# Altium project CW341_KintexUltraScaleTarget.PrjPcb (part 3 of 3)
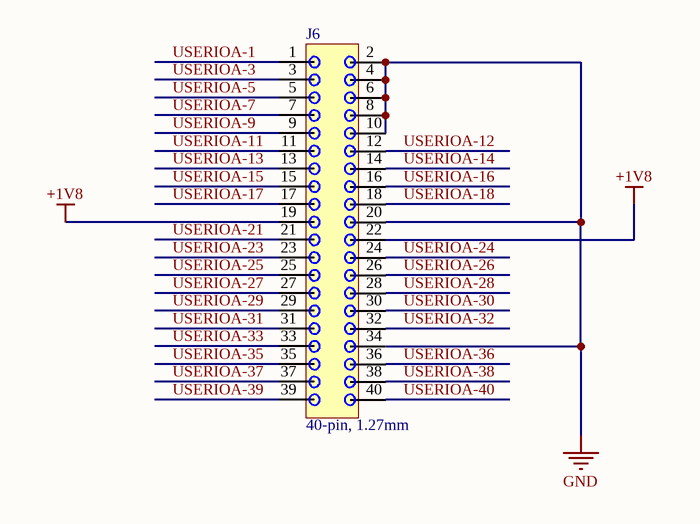
[diagram p17: CW341_FPGA_USERIOA.SchDoc]

## Nets that join several sheets
+1V0_VCCINT: CW341_FPGA_DECOUP (10 pins), CW341_FPGA_PWR (53 pins), CW341_PowerMeasure (TP1.1)
+1V0_VCCINT_SHUNTLOW: CW341_FPGA_PWR (PWR1.23 PWR1.24 PWR1.25), CW341_PowerMeasure (6 pins)
+1V8: CW341_Edge (J1.A7 J1.A8), CW341_FPGA_DECOUP (49 pins), CW341_FPGA_PWR (17 pins), CW341_FPGA_CFG (J2.2 R4.1), CW341_FPGAIO_1 (7 pins), CW341_FPGAIO_2 (13 pins), CW341_FPGAIO_3 (13 pins), CW341_FPGAIO_4 (7 pins), CW341_FPGAIO_5 (14 pins), CW341_SRAM (9 pins), CW341_HyperRam (12 pins), CW341_FPGA_USERIOA (J6.19 J6.22)
+1V85_XADC_VCC: CW341_FPGA_PWR (C28.1 U1.U12), CW341_XADC (7 pins)
+3V3: CW341_Edge (J1.A3 J1.A4), CW341_PowerMeasure (C88.1 L7.1), CW341_XADC (C19.1 L6.1)
+5V: CW341_Edge (J1.B3 J1.B4 J1.B5 J1.B6), CW341_FPGA_PWR (PWR1.1 PWR1.2 PWR1.3)
+VCCIOB: CW341_Edge (J1.B11), CW341_FPGA_DECOUP (6 pins), CW341_FPGAIO_1 (6 pins)
GND: CW341_Edge (30 pins), CW341_FPGA_DECOUP (65 pins), CW341_FPGA_PWR (284 pins), CW341_FPGA_CFG (11 pins), CW341_FPGA_MGT (U1.A33 U1.A34 U1.AP5 U1.AP6), CW341_FPGAIO_3 (R1.2), CW341_PowerMeasure (10 pins), CW341_SRAM (C9.2 C11.2 U2.12 U2.34), CW341_XADC (C19.2 L4.1), CW341_HyperRam (12 pins), CW341_FPGA_USERIOA (7 pins)
XADC_VREF_N: CW341_Edge (J1.A16 J1.B16), CW341_FPGA_PWR (C28.2 U1.V11), CW341_FPGAIO_2 (U1.AE15 U1.AF14 U1.AF18 U1.AL15), CW341_XADC (20 pins)
/USB_CE: CW341_Edge (J1.A81), CW341_FPGAIO_3 (U1.D23)
/USB_RD: CW341_Edge (J1.A80), CW341_FPGAIO_3 (U1.C23)
AD0P: CW341_FPGAIO_2 (U1.AE16), CW341_XADC (R16.2)
AD1P: CW341_FPGAIO_2 (U1.AF15), CW341_XADC (R17.2)
AD8P: CW341_FPGAIO_2 (U1.AE18), CW341_XADC (R7.2)
AD12P: CW341_FPGAIO_2 (U1.AK15), CW341_XADC (R6.2)
CFG_CLK: CW341_Edge (J1.A57), CW341_FPGA_CFG (R3.2)
CFG_D0: CW341_Edge (J1.A59), CW341_FPGA_CFG (U1.AC7)
CFG_D1: CW341_Edge (J1.B61), CW341_FPGA_CFG (U1.AB7)
CFG_D2: CW341_Edge (J1.A60), CW341_FPGA_CFG (U1.AA7)
CFG_D3: CW341_Edge (J1.B62), CW341_FPGA_CFG (U1.Y7)
CFG_D4: CW341_Edge (J1.A61), CW341_FPGAIO_3 (U1.M20)
CFG_D5: CW341_Edge (J1.B63), CW341_FPGAIO_3 (U1.L20)
CFG_D6: CW341_Edge (J1.A62), CW341_FPGAIO_3 (U1.R21)
CFG_D7: CW341_Edge (J1.B64), CW341_FPGAIO_3 (U1.R22)
CFG_D8_A0: CW341_Edge (J1.A63), CW341_FPGAIO_3 (U1.P20)
CFG_D9_A1: CW341_Edge (J1.B65), CW341_FPGAIO_3 (U1.P21)
CFG_D10_A2: CW341_Edge (J1.A64), CW341_FPGAIO_3 (U1.N22)
CFG_D11_A3: CW341_Edge (J1.B66), CW341_FPGAIO_3 (U1.M22)
CFG_D12_A4: CW341_Edge (J1.A65), CW341_FPGAIO_3 (U1.R23)
CFG_D13_A5: CW341_Edge (J1.B67), CW341_FPGAIO_3 (U1.P23)
CFG_D14_A6: CW341_Edge (J1.A66), CW341_FPGAIO_3 (U1.R25)
CFG_D15_A7: CW341_Edge (J1.B68), CW341_FPGAIO_3 (U1.R26)
CFG_DONE: CW341_Edge (J1.A68), CW341_FPGA_CFG (U1.N7)
CFG_DOUT: CW341_Edge (J1.B70), CW341_FPGAIO_3 (U1.K21)
CFG_EMCCLK: CW341_Edge (J1.B71), CW341_FPGAIO_3 (U1.K20)
CFG_INITB: CW341_Edge (J1.A70), CW341_FPGA_CFG (U1.V7)
CFG_PGM: CW341_Edge (J1.A69), CW341_FPGA_CFG (U1.T7)
CFG_RDWR: CW341_Edge (J1.A78), CW341_FPGA_CFG (U1.U7)
CWIO_HS1: CW341_Edge (J1.A27), CW341_FPGAIO_1 (U1.AK12)
CWIO_HS2: CW341_Edge (J1.B27), CW341_FPGAIO_1 (U1.AL12)
CWIO_IO4: CW341_Edge (J1.B26), CW341_FPGAIO_1 (U1.AM11)
FPGA_M0: CW341_Edge (J1.B79), CW341_FPGA_CFG (U1.K7)
FPGA_M1: CW341_Edge (J1.B80), CW341_FPGA_CFG (U1.L7)
FPGA_M2: CW341_Edge (J1.B81), CW341_FPGA_CFG (U1.M7)
HYPR_1_~{CS}: CW341_FPGAIO_4 (U1.F15), CW341_HyperRam (U3.A3)
HYPR_1_DQ0: CW341_FPGAIO_4 (U1.F17), CW341_HyperRam (U3.D3)
HYPR_1_DQ1: CW341_FPGAIO_4 (U1.D18), CW341_HyperRam (U3.D2)
HYPR_1_DQ2: CW341_FPGAIO_4 (U1.D16), CW341_HyperRam (U3.C4)
HYPR_1_DQ3: CW341_FPGAIO_4 (U1.E17), CW341_HyperRam (U3.D4)
HYPR_1_DQ4: CW341_FPGAIO_4 (U1.G19), CW341_HyperRam (U3.D5)
HYPR_1_DQ5: CW341_FPGAIO_4 (U1.H17), CW341_HyperRam (U3.E3)
HYPR_1_DQ6: CW341_FPGAIO_4 (U1.D19), CW341_HyperRam (U3.E2)
HYPR_1_DQ7: CW341_FPGAIO_4 (U1.E18), CW341_HyperRam (U3.E1)
HYPR_1_N: CW341_FPGAIO_4 (U1.G14), CW341_HyperRam (U3.B1)
HYPR_1_P: CW341_FPGAIO_4 (U1.G15), CW341_HyperRam (U3.B2)
HYPR_1_~{RESET}: CW341_FPGAIO_4 (U1.G16), CW341_HyperRam (U3.A4)
HYPR_1_RWDS: CW341_FPGAIO_4 (U1.E16), CW341_HyperRam (U3.C3)
HYPR_2_~{CS}: CW341_FPGAIO_4 (U1.L18), CW341_HyperRam (U4.A3)
HYPR_2_DQ0: CW341_FPGAIO_4 (U1.K18), CW341_HyperRam (U4.D3)
HYPR_2_DQ1: CW341_FPGAIO_4 (U1.J14), CW341_HyperRam (U4.D2)
HYPR_2_DQ2: CW341_FPGAIO_4 (U1.L15), CW341_HyperRam (U4.C4)
HYPR_2_DQ3: CW341_FPGAIO_4 (U1.J19), CW341_HyperRam (U4.D4)
HYPR_2_DQ4: CW341_FPGAIO_4 (U1.H19), CW341_HyperRam (U4.D5)
HYPR_2_DQ5: CW341_FPGAIO_4 (U1.K17), CW341_HyperRam (U4.E3)
HYPR_2_DQ6: CW341_FPGAIO_4 (U1.J15), CW341_HyperRam (U4.E2)
HYPR_2_DQ7: CW341_FPGAIO_4 (U1.J18), CW341_HyperRam (U4.E1)
HYPR_2_N: CW341_FPGAIO_4 (U1.J16), CW341_HyperRam (U4.B1)
HYPR_2_P: CW341_FPGAIO_4 (U1.K16), CW341_HyperRam (U4.B2)
HYPR_2_~{RESET}: CW341_FPGAIO_4 (U1.L19), CW341_HyperRam (U4.A4)
HYPR_2_RWDS: CW341_FPGAIO_4 (U1.K15), CW341_HyperRam (U4.C3)
OT_ADC1: CW341_Edge (J1.B12), CW341_XADC (R22.1)
OT_ADC2: CW341_Edge (J1.B13), CW341_XADC (R19.1)
OT_ANALOG0_ADC3: CW341_Edge (J1.B14), CW341_XADC (R13.1)
OT_ANALOG1_ADC4: CW341_Edge (J1.B15), CW341_XADC (R10.1)
OT_IOA0: CW341_Edge (J1.A29), CW341_FPGAIO_1 (U1.AN26)
OT_IOA1: CW341_Edge (J1.B29), CW341_FPGAIO_1 (U1.AK26)
OT_IOA2: CW341_Edge (J1.A30), CW341_FPGAIO_1 (U1.AN27)
OT_IOA3: CW341_Edge (J1.B30), CW341_FPGAIO_1 (U1.AP26)
OT_IOA4: CW341_Edge (J1.A31), CW341_FPGAIO_1 (U1.AP28)
OT_IOA5: CW341_Edge (J1.B31), CW341_FPGAIO_1 (U1.AM27)
OT_IOA6: CW341_Edge (J1.A32), CW341_FPGAIO_1 (U1.AP29)
OT_IOA7: CW341_Edge (J1.B32), CW341_FPGAIO_1 (U1.AN28)
OT_IOA8: CW341_Edge (J1.A33), CW341_FPGAIO_1 (U1.AP30)
OT_IOB0: CW341_Edge (J1.A18), CW341_FPGAIO_1 (U1.AP8)
OT_IOB1: CW341_Edge (J1.B18), CW341_FPGAIO_1 (U1.AN8)
OT_IOB2: CW341_Edge (J1.A19), CW341_FPGAIO_1 (U1.AP9)
OT_IOB3: CW341_Edge (J1.B19), CW341_FPGAIO_1 (U1.AL8)
OT_IOB4: CW341_Edge (J1.A20), CW341_FPGAIO_1 (U1.AL10)
OT_IOB5: CW341_Edge (J1.B20), CW341_FPGAIO_1 (U1.AN9)
OT_IOB6: CW341_Edge (J1.A21), CW341_FPGAIO_1 (U1.AM10)
OT_IOB7: CW341_Edge (J1.B21), CW341_FPGAIO_1 (U1.AP10)
OT_IOB8: CW341_Edge (J1.A22), CW341_FPGAIO_1 (U1.AL9)
OT_IOB9: CW341_Edge (J1.B22), CW341_FPGAIO_1 (U1.AP11)
OT_IOB10: CW341_Edge (J1.A23), CW341_FPGAIO_1 (U1.AM12)
OT_IOB11: CW341_Edge (J1.B23), CW341_FPGAIO_1 (U1.AN11)
OT_IOB12: CW341_Edge (J1.A24), CW341_FPGAIO_1 (U1.AN12)
OT_IOC0: CW341_Edge (J1.A50), CW341_FPGAIO_3 (U1.T24)
OT_IOC1: CW341_Edge (J1.B50), CW341_FPGAIO_3 (U1.T25)
OT_IOC2: CW341_Edge (J1.A51), CW341_FPGAIO_3 (U1.R27)
OT_IOC3: CW341_Edge (J1.B51), CW341_FPGAIO_3 (U1.P25)
OT_IOC4: CW341_Edge (J1.A52), CW341_FPGAIO_3 (U1.N24)
OT_IOC5: CW341_Edge (J1.B52), CW341_FPGAIO_3 (U1.M24)
OT_IOC6: CW341_Edge (J1.B53), CW341_FPGAIO_3 (U1.M27)
OT_IOC7: CW341_Edge (J1.B54), CW341_FPGAIO_3 (U1.L25)
OT_IOC8: CW341_Edge (J1.B55), CW341_FPGAIO_3 (U1.K23)
OT_IOC9: CW341_Edge (J1.B56), CW341_FPGAIO_3 (U1.K26)
OT_IOC10: CW341_Edge (J1.B57), CW341_FPGAIO_3 (U1.J26)
OT_IOC11: CW341_Edge (J1.B58), CW341_FPGAIO_3 (U1.H24)
OT_IOC12: CW341_Edge (J1.B59), CW341_FPGAIO_3 (U1.H26)
OT_IOR0_USR_DBG_TMS: CW341_Edge (J1.A42), CW341_FPGAIO_1 (U1.AL33)
OT_IOR1_USR_DBG_TDO: CW341_Edge (J1.B42), CW341_FPGAIO_1 (U1.AK27)
OT_IOR2_USR_DBG_TDI: CW341_Edge (J1.A43), CW341_FPGAIO_1 (U1.AK31)
OT_IOR3_USR_DBG_TCK: CW341_Edge (J1.B43), CW341_FPGAIO_1 (U1.AL34)
OT_IOR4_USR_DBG_TRST: CW341_Edge (J1.A44), CW341_FPGAIO_1 (U1.AJ34)
OT_IOR5: CW341_Edge (J1.B44), CW341_FPGAIO_1 (U1.AK30)
OT_IOR6: CW341_Edge (J1.A45), CW341_FPGAIO_1 (U1.AH32)
OT_IOR7: CW341_Edge (J1.B45), CW341_FPGAIO_1 (U1.AJ33)
OT_IOR8: CW341_Edge (J1.A46), CW341_FPGAIO_1 (U1.AH34)
OT_IOR9: CW341_Edge (J1.B46), CW341_FPGAIO_1 (U1.AH31)
OT_IOR10: CW341_Edge (J1.A47), CW341_FPGAIO_1 (U1.AH27)
OT_IOR11: CW341_Edge (J1.B47), CW341_FPGAIO_1 (U1.AH33)
OT_IOR12: CW341_Edge (J1.A48), CW341_FPGAIO_1 (U1.AH28)
OT_IOR13: CW341_Edge (J1.B48), CW341_FPGAIO_1 (U1.AH26)
OT_PORN: CW341_Edge (J1.A53), CW341_FPGAIO_3 (U1.G26)
OT_SPI_DEV_CLK: CW341_Edge (J1.A35), CW341_FPGAIO_1 (U1.AM30)
OT_SPI_DEV_CS_L: CW341_Edge (J1.A40), CW341_FPGAIO_1 (U1.AM34)
OT_SPI_DEV_D0: CW341_Edge (J1.A36), CW341_FPGAIO_1 (U1.AL30)
OT_SPI_DEV_D1: CW341_Edge (J1.A37), CW341_FPGAIO_1 (U1.AM26)
OT_SPI_DEV_D2: CW341_Edge (J1.A38), CW341_FPGAIO_1 (U1.AN32)
OT_SPI_DEV_D3: CW341_Edge (J1.A39), CW341_FPGAIO_1 (U1.AN34)
OT_SPI_HOST_CLK: CW341_Edge (J1.B35), CW341_FPGAIO_1 (U1.AP31)
OT_SPI_HOST_CS_L: CW341_Edge (J1.B40), CW341_FPGAIO_1 (U1.AL32)
OT_SPI_HOST_D0: CW341_Edge (J1.B36), CW341_FPGAIO_1 (U1.AP33)
OT_SPI_HOST_D1: CW341_Edge (J1.B37), CW341_FPGAIO_1 (U1.AP34)
OT_SPI_HOST_D2: CW341_Edge (J1.B38), CW341_FPGAIO_1 (U1.AL27)
OT_SPI_HOST_D3: CW341_Edge (J1.B39), CW341_FPGAIO_1 (U1.AN33)
PGOOD_VCCINT: CW341_Edge (J1.B10), CW341_FPGA_PWR (PWR1.9)
PLL2_CLK_ALT: CW341_FPGAIO_1 (SJ1.3), CW341_FPGAIO_3 (U1.E22)
PLL_CLK1: CW341_Edge (J1.A55), CW341_FPGAIO_1 (U1.AJ29)
PLL_CLK2: CW341_Edge (J1.B33), CW341_FPGAIO_1 (SJ1.2)
PMOD2_IO4_3V3: CW341_Edge (J1.A25), CW341_FPGAIO_1 (U1.AN13)
PMOD2_IO7_3V3: CW341_Edge (J1.B25), CW341_FPGAIO_1 (U1.AP13)
PMOD2_IO8_3V3: CW341_Edge (J1.A26), CW341_FPGAIO_1 (U1.AL13)
PWR_EN: CW341_Edge (J1.A13), CW341_FPGA_PWR (PWR1.10)
SRAM_A0: CW341_FPGAIO_2 (U1.AE21), CW341_SRAM (U2.5)
SRAM_A1: CW341_FPGAIO_2 (U1.AD20), CW341_SRAM (U2.4)
SRAM_A2: CW341_FPGAIO_2 (U1.AD21), CW341_SRAM (U2.3)
SRAM_A3: CW341_FPGAIO_2 (U1.AF23), CW341_SRAM (U2.2)
SRAM_A4: CW341_FPGAIO_2 (U1.AF24), CW341_SRAM (U2.1)
SRAM_A5: CW341_FPGAIO_2 (U1.AH24), CW341_SRAM (U2.44)
SRAM_A6: CW341_FPGAIO_2 (U1.AK21), CW341_SRAM (U2.43)
SRAM_A7: CW341_FPGAIO_2 (U1.AP20), CW341_SRAM (U2.42)
SRAM_A8: CW341_FPGAIO_2 (U1.AP24), CW341_SRAM (U2.27)
SRAM_A9: CW341_FPGAIO_2 (U1.AN23), CW341_SRAM (U2.26)
SRAM_A10: CW341_FPGAIO_2 (U1.AJ24), CW341_SRAM (U2.25)
SRAM_A11: CW341_FPGAIO_2 (U1.AL25), CW341_SRAM (U2.24)
SRAM_A12: CW341_FPGAIO_2 (U1.AE23), CW341_SRAM (U2.22)
SRAM_A13: CW341_FPGAIO_2 (U1.AK20), CW341_SRAM (U2.21)
SRAM_A14: CW341_FPGAIO_2 (U1.AP21), CW341_SRAM (U2.20)
SRAM_A15: CW341_FPGAIO_2 (U1.AM20), CW341_SRAM (U2.19)
SRAM_A16: CW341_FPGAIO_2 (U1.AH22), CW341_SRAM (U2.18)
SRAM_A17: CW341_FPGAIO_2 (U1.AJ25), CW341_SRAM (U2.23)
SRAM_A18: CW341_FPGAIO_2 (U1.AL24), CW341_SRAM (U2.28)
SRAM_~{CS1}: CW341_FPGAIO_2 (U1.AG24), CW341_SRAM (R14.2 U2.6)
SRAM_DQ0: CW341_FPGAIO_2 (U1.AE20), CW341_SRAM (U2.7)
SRAM_DQ1: CW341_FPGAIO_2 (U1.AF22), CW341_SRAM (U2.8)
SRAM_DQ2: CW341_FPGAIO_2 (U1.AF20), CW341_SRAM (U2.9)
SRAM_DQ3: CW341_FPGAIO_2 (U1.AG22), CW341_SRAM (U2.10)
SRAM_DQ4: CW341_FPGAIO_2 (U1.AG20), CW341_SRAM (U2.13)
SRAM_DQ5: CW341_FPGAIO_2 (U1.AH23), CW341_SRAM (U2.14)
SRAM_DQ6: CW341_FPGAIO_2 (U1.AH21), CW341_SRAM (U2.15)
SRAM_DQ7: CW341_FPGAIO_2 (U1.AL20), CW341_SRAM (U2.16)
SRAM_DQ8: CW341_FPGAIO_2 (U1.AL23), CW341_SRAM (U2.29)
SRAM_DQ9: CW341_FPGAIO_2 (U1.AP23), CW341_SRAM (U2.30)
SRAM_DQ10: CW341_FPGAIO_2 (U1.AJ23), CW341_SRAM (U2.31)
SRAM_DQ11: CW341_FPGAIO_2 (U1.AN22), CW341_SRAM (U2.32)
SRAM_DQ12: CW341_FPGAIO_2 (U1.AL22), CW341_SRAM (U2.35)
SRAM_DQ13: CW341_FPGAIO_2 (U1.AM21), CW341_SRAM (U2.36)
SRAM_DQ14: CW341_FPGAIO_2 (U1.AN21), CW341_SRAM (U2.37)
SRAM_DQ15: CW341_FPGAIO_2 (U1.AK22), CW341_SRAM (U2.38)
SRAM_~{LB}: CW341_FPGAIO_2 (U1.AE26), CW341_SRAM (R15.2 U2.39)
SRAM_~{OE}: CW341_FPGAIO_2 (U1.AE25), CW341_SRAM (R8.2 U2.41)
SRAM_~{UB}: CW341_FPGAIO_2 (U1.AG25), CW341_SRAM (R11.2 U2.40)
SRAM_~{WE}: CW341_FPGAIO_2 (U1.AJ20), CW341_SRAM (R18.2 U2.17)
USB_CLK0: CW341_Edge (J1.A79), CW341_FPGAIO_3 (U1.C24)
USERIOA-1: CW341_FPGAIO_4 (U1.C14), CW341_FPGA_USERIOA (J6.1)
USERIOA-3: CW341_FPGAIO_4 (U1.B14), CW341_FPGA_USERIOA (J6.3)
USERIOA-5: CW341_FPGAIO_4 (U1.A14), CW341_FPGA_USERIOA (J6.5)
USERIOA-7: CW341_FPGAIO_4 (U1.B15), CW341_FPGA_USERIOA (J6.7)
USERIOA-9: CW341_FPGAIO_4 (U1.A15), CW341_FPGA_USERIOA (J6.9)
USERIOA-11: CW341_FPGAIO_4 (U1.B16), CW341_FPGA_USERIOA (J6.11)
USERIOA-12: CW341_FPGAIO_3 (U1.G20), CW341_FPGA_USERIOA (J6.12)
USERIOA-13: CW341_FPGAIO_4 (U1.A18), CW341_FPGA_USERIOA (J6.13)
USERIOA-14: CW341_FPGAIO_3 (U1.F20), CW341_FPGA_USERIOA (J6.14)
USERIOA-15: CW341_FPGAIO_4 (U1.C19), CW341_FPGA_USERIOA (J6.15)
USERIOA-16: CW341_FPGAIO_3 (U1.E20), CW341_FPGA_USERIOA (J6.16)
USERIOA-17: CW341_FPGAIO_4 (U1.A19), CW341_FPGA_USERIOA (J6.17)
USERIOA-18: CW341_FPGAIO_3 (U1.B20), CW341_FPGA_USERIOA (J6.18)
USERIOA-21: CW341_FPGAIO_4 (U1.H18), CW341_FPGA_USERIOA (J6.21)
USERIOA-23: CW341_FPGAIO_4 (U1.F19), CW341_FPGA_USERIOA (J6.23)
USERIOA-24: CW341_FPGAIO_3 (U1.D20), CW341_FPGA_USERIOA (J6.24)
USERIOA-25: CW341_FPGAIO_4 (U1.C18), CW341_FPGA_USERIOA (J6.25)
USERIOA-26: CW341_FPGAIO_3 (U1.G21), CW341_FPGA_USERIOA (J6.26)
USERIOA-27: CW341_FPGAIO_4 (U1.B19), CW341_FPGA_USERIOA (J6.27)
USERIOA-28: CW341_FPGAIO_3 (U1.D21), CW341_FPGA_USERIOA (J6.28)
USERIOA-29: CW341_FPGAIO_4 (U1.D14), CW341_FPGA_USERIOA (J6.29)
USERIOA-30: CW341_FPGAIO_3 (U1.G22), CW341_FPGA_USERIOA (J6.30)
USERIOA-31: CW341_FPGAIO_4 (U1.D15), CW341_FPGA_USERIOA (J6.31)
USERIOA-32: CW341_FPGAIO_3 (U1.F23), CW341_FPGA_USERIOA (J6.32)
USERIOA-33: CW341_FPGAIO_4 (U1.E15), CW341_FPGA_USERIOA (J6.33)
USERIOA-35: CW341_FPGAIO_4 (U1.F14), CW341_FPGA_USERIOA (J6.35)
USERIOA-36: CW341_FPGAIO_3 (U1.F24), CW341_FPGA_USERIOA (J6.36)
USERIOA-37: CW341_FPGAIO_4 (U1.G17), CW341_FPGA_USERIOA (J6.37)
USERIOA-38: CW341_FPGAIO_3 (U1.F25), CW341_FPGA_USERIOA (J6.38)
USERIOA-39: CW341_FPGAIO_4 (U1.F18), CW341_FPGA_USERIOA (J6.39)
USERIOA-40: CW341_FPGAIO_3 (U1.E25), CW341_FPGA_USERIOA (J6.40)
USR_DBG_nRST: CW341_Edge (J1.B41), CW341_FPGAIO_3 (U1.E23)
USRUSB_OE: CW341_Edge (J1.B77), CW341_FPGAIO_3 (U1.D24)
USRUSB_PWREN: CW341_Edge (J1.A72), CW341_FPGAIO_3 (U1.D29)
USRUSB_RCV: CW341_Edge (J1.A76), CW341_FPGAIO_3 (U1.F27)
USRUSB_SOFTCN: CW341_Edge (J1.B75), CW341_FPGAIO_3 (U1.E27)
USRUSB_SPD: CW341_Edge (J1.B76), CW341_FPGAIO_3 (U1.A28)
USRUSB_SUS: CW341_Edge (J1.B78), CW341_FPGAIO_3 (U1.A25)
USRUSB_VBUS_DETECT: CW341_Edge (J1.A73), CW341_FPGAIO_3 (U1.B29)
USRUSB_VM: CW341_Edge (J1.A74), CW341_FPGAIO_3 (U1.B27)
USRUSB_VMO: CW341_Edge (J1.B74), CW341_FPGAIO_3 (U1.A27)
USRUSB_VP: CW341_Edge (J1.A75), CW341_FPGAIO_3 (U1.C27)
USRUSB_VPO: CW341_Edge (J1.B73), CW341_FPGAIO_3 (U1.E28)
VCCINT_SCL: CW341_Edge (J1.A12), CW341_FPGA_PWR (PWR1.8)
VCCINT_SDA: CW341_Edge (J1.A11), CW341_FPGA_PWR (PWR1.7)
XADC_DX_N: CW341_Edge (J1.A15), CW341_FPGA_CFG (U1.Y11)
XADC_DX_P: CW341_Edge (J1.A14), CW341_FPGA_CFG (U1.Y12)
XADC_VREF_P: CW341_FPGA_PWR (U1.W12), CW341_XADC (C13.1 U6.2)